# Altium schematic sheet Conversion5V.SchDoc
size A4; SheetNumber: 9; SheetTotal: 9
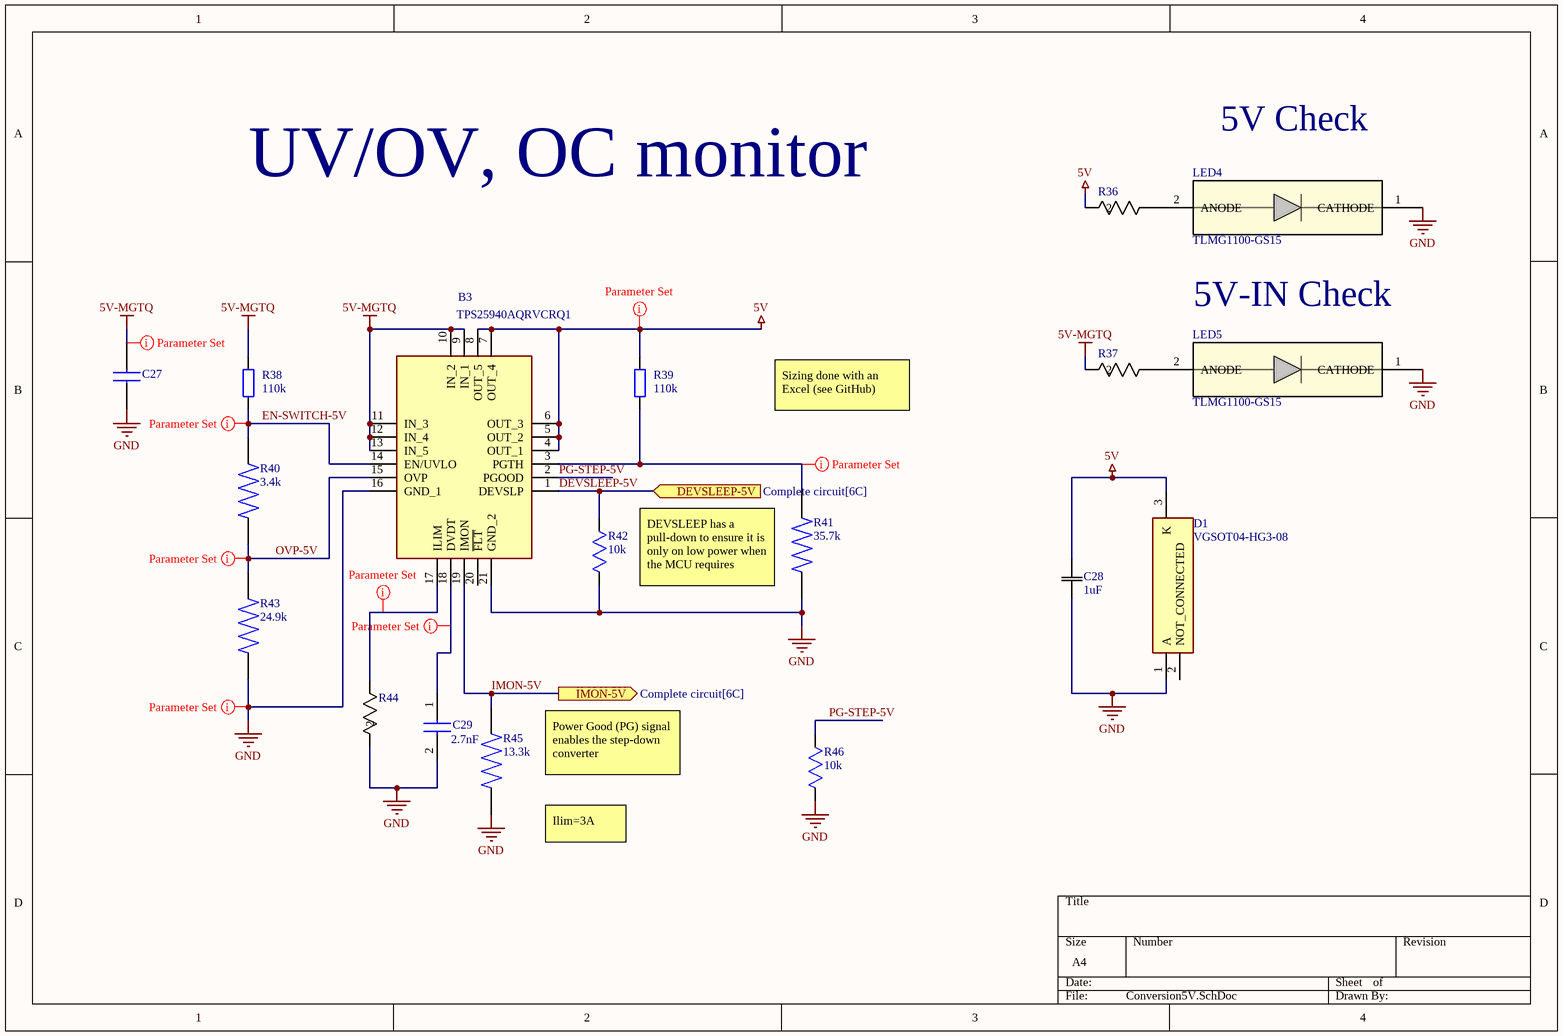
[diagram p0: Conversion5V.SchDoc]

## Parts
B3  TPS25940AQRVCRQ1  [QFN50P300X400X80-21N]
C27  C1206C104K3GACAUTO  [CAPC3216X180N]  (value not drawn)
C28  Capacitance: 1uF  [CAPC18095_95N_KEM]  (hidden comment: C0603X105J4RACAUTO)
C29  Capacitance: 2.7nF  [GCM188]  (hidden comment: GCM1885C1H272FA16J)
D1  VGSOT04-HG3-08  [SOT95P242X112-3N]
LED4  TLMG1100-GS15  [LED_0603_VIS]
LED5  TLMG1100-GS15  [LED_0603_VIS]
R36  MCT0603MD7502BP100  [RES_MCT_0603_VIS]  (value not drawn)
R37  MCT0603MD7502BP100  [RES_MCT_0603_VIS]  (value not drawn)
R38  value 110k  [WRIS-RSKS_0603_Reflow]  (hidden comment: 560112116148)
R39  value 110k  [WRIS-RSKS_0603_Reflow]  (hidden comment: 560112116148)
R40  value 3.4k  [RESC1508X60N]  (hidden comment: RQ73C1J3K4BTD)
R41  value 35.7k  [RESC1508X50N]  (hidden comment: RNCP0603FTD35K7)
R42  value 10k  [RES_ERA3ARB103V]  (hidden comment: ERA3ARB103V)
R43  value 24.9k  [RESC1508X50N]  (hidden comment: RNCP0603FTD24K9)
R44  CRCW060330K1FKEAHP  [RES_CRCW_0603_VIS]  (value not drawn)
R45  value 13.3k  [RESC1608X55N]  (hidden comment: CRCW060313K3FKEAHP)
R46  value 10k  [RES_ERA3ARB103V]  (hidden comment: ERA3ARB103V)

## Ports
DEVSLEEP-5V (in, see Complete circuit[6C]), IMON-5V (out, see Complete circuit[6C])

## Nets
5V: B3.4(OUT_1) B3.5(OUT_2) B3.6(OUT_3) B3.7(OUT_4) B3.8(OUT_5) C28.2 D1.3(K) R36.2 R39.1
5V-MGTQ: B3.9(IN_1) B3.10(IN_2) B3.11(IN_3) B3.12(IN_4) B3.13(IN_5) C27.1 R37.2 R38.1
GND: B3.16(GND_1) B3.21(GND_2) C27.2 C28.1 C29.2 D1.1(A) LED4.1(CATHODE) LED5.1(CATHODE) R41.1 R42.1 R43.1 R44.2 R45.1 R46.1
DEVSLEEP-5V: B3.1(DEVSLP) R42.2 ; port DEVSLEEP-5V
EN-SWITCH-5V: B3.14(EN/UVLO) R38.2 R40.2
IMON-5V: B3.19(IMON) R45.2 ; port IMON-5V
OVP-5V: B3.15(OVP) R40.1 R43.2
PG-STEP-5V: B3.2(PGOOD) R46.2
NetB3_3: B3.3(PGTH) R39.2 R41.2
NetB3_17: B3.17(ILIM) R44.1
NetB3_18: B3.18(DVDT) C29.1
NetLED4_2: LED4.2(ANODE) R36.1
NetLED5_2: LED5.2(ANODE) R37.1

Not connected (* = marked no-connect by the designer): B3 20(~{FLT}); D1 2(NOT_CONNECTED)

## Layout directives
net class SupplyMax: 5V-MGTQ
net class SupplyMin: 5V, EN-SWITCH-5V, GND, NetB3_3, NetB3_17, NetB3_18, OVP-5V

## Notes on the sheet
- 5V Check
- UV/OV, OC monitor
- 5V-IN Check
- Sizing done with an Excel (see GitHub)
- DEVSLEEP has a pull-down to ensure it is only on low power when the MCU requires
- Power Good (PG) signal enables the step-down converter
- Ilim=3A

## Library data of the parts
B3 = CMP-011-00016-1: 2.7V-18V Automotive Current-Limited Load Switch with Current Sense & Short-to-Battery Protection; Manufacturer_Name: Texas Instruments; Geometry.Height: 0.8mm; Source: TPS25940AQRVCRQ1.SchLib; Datasheet Link: http://www.ti.com/lit/gpn/tps25940-q1; Design Item ID: TPS25940AQRVCRQ1; Mouser Price/Stock: https://www.mouser.co.uk/ProductDetail/Texas-Instruments/TPS25940AQRVCRQ1?qs=osPbIpHqQ9Uam0Tf4VM8lQ%3D%3D; Mouser Part Number: 595-TPS25940AQRVCRQ1; Manufacturer_Part_Number: TPS25940AQRVCRQ1
C27 = CMP-001-00115-2: SMD Auto C0G, Ceramic, 0.1 uF, 10%, 25 VDC, 62.5 VDC, 125C, -55C, C0G, SMD, MLCC, Ultra-Stable, Low Loss, Automotive Grade, 0.1 % , 10 GOhms, 36 mg, 1206, 3.2mm, 1.6mm, 1.6mm, 0.5mm, 2000, 78  Weeks, 120; Manufacturer_Name: KEMET; Geometry.Height: 1.8mm; Design Item ID: C1206C104K3GACAUTO; Manufacturer_Part_Number: C1206C104K3GACAUTO; Source: C1206C104K3GACAUTO.SchLib; Datasheet Link: https://content.kemet.com/datasheets/KEM_C1022_C0G_AUTO_SMD.pdf; Mouser Part Number: 80-C1206C104K3GAUTO; Mouser Price/Stock: https://www.mouser.co.uk/ProductDetail/KEMET/C1206C104K3GACAUTO?qs=iLbezkQI%252BsiL409OZdKKSA%3D%3D
C28 = CMP-001-00117-3: SMD Auto X7R Flex, Ceramic, 1 uF, 5%, 16 VDC, X7R, SMD, MLCC, FT-CAP, Automotive Grade, 0603; Manufacturer_Name: Kemet; Copyright: Copyright (C) 2025 Ultra Librarian. All rights reserved.; Source: C0603X105J4RACAUTO.SchLib; Manufacturer_Part_Number: C0603X105J4RACAUTO; Design Item ID: C0603X105J4RACAUTO
C29 = GCM1885C1H272FA16J: Multilayer Ceramic Capacitors MLCC - SMD/SMT 2700 pF 50 VDC 1% 0603 C0G (NP0) AEC-Q200; Manufacturer_Name: Murata Electronics; Datasheet Link: https://search.murata.co.jp/Ceramy/image/img/A01X/G101/ENG/GCM1885C1H272FA16-01A.pdf; Height: 0.9mm; Manufacturer_Part_Number: GCM1885C1H272FA16J
D1 = VGSOT04-HG3-08: Diode ESD (Uni-directional); Manufacturer_Name: Vishay; Datasheet Link: https://www.vishay.com/docs/86326/vgsot03-vgsot36.pdf; Height: 1.12mm; Manufacturer_Part_Number: VGSOT04-HG3-08
LED4 LED5 = CMP-007-00036-1: CHIPLED(SMD 0603-LED) GREEN U.BRIGHT-e4; Manufacturer_Name: Vishay; RefDes: RefDes; Copyright: Copyright (C) 2025 Ultra Librarian. All rights reserved.; Type: Type; Design Item ID: TLMG1100-GS15; Manufacturer_Part_Number: TLMG1100-GS15; Source: TLMG1100-GS15.SchLib
R36 R37 = CMP-009-00216-2: MCT 0603-25 0.1% AT P1 75K; Manufacturer_Name: Vishay; Source: MCT0603MD7502BP100.SchLib; Copyright: Copyright (C) 2025 Ultra Librarian. All rights reserved.; Design Item ID: MCT0603MD7502BP100; Manufacturer_Part_Number: MCT0603MD7502BP100
R38 R39 = CMP-009-00240-1: WRIS-RSKS Thick Film Resistor, size 0603, 110kO, +/-1%, 100mW; Manufacturer: Wurth Elektronik; Temperature Coefficient of Resistance Min: -100ppm/°C; Temperature Coefficient of Resistance Max: 100ppm/°C; Limiting Element Voltage: 75V; Length: 1.6mm; Rated Power: 100mW; Category: Thick Film Resistors; Resistance Tolerance: +/-1%; Source: WRIS-RSKS.SchLib; Height: 0.45mm; Case/Package: 0603; ComponentLink2Description: Datasheet Link; Match Code: WRIS-RSKS; Mount: Surface Mount; Width: 0.8mm; Packaging: Tape and Reel; Component Type: Standard; ComponentLink1URL: https://www.we-online.com/redexpert/article/560112116148?ad; Min Operating Temperature: -55°C; Design Item ID: 560112116148; Max Operating Temperature: 155°C; ComponentLink2URL: https://www.we-online.com/redexpert/spec/560112116148?ad; Pins: 2; ComponentLink1Description: Website Link; Manufacturer Part Number: 560112116148
R40 = CMP-009-00210-1: MP: RQ73C1J3K4BTD; Pins: 2; Source: RQ73C1J3K4BTD.SchLib; Price: None; Availability: Unavailable; Design Item ID: RQ73C1J3K4BTD; Component Type: Standard; Case/Package: None
R41 = CMP-009-00242-1: Res Thin Film 0603 35.7K Ohm 1% 0.125W(1/8W) Â±100ppm/C Sulfur Resistant Molded SMD Paper T/R; MF: Stackpole Electronics Inc; Case/Package: 1508 Stackpole; Component Type: Standard; Pins: 2; Design Item ID: RNCP0603FTD35K7; Check_prices: https://www.snapeda.com/parts/RNCP0603FTD35K7/Stackpole+Electronics/view-part/?ref=eda; Source: RNCP0603FTD35K7.SchLib; MP: RNCP0603FTD35K7; SnapEDA_Link: https://www.snapeda.com/parts/RNCP0603FTD35K7/Stackpole+Electronics/view-part/?ref=snap
R42 R46 = CMP-009-00245-3: Thin Film Resistors - SMD 0603 10Kohm 0.1% 10ppm AEC-Q200; Design Item ID: ERA3ARB103V; Case/Package: None; Pins: 2; Source: ERA3ARB103V.SchLib; Component Type: Standard; MP: ERA3ARB103V; Availability: Unavailable; Price: None
R43 = CMP-009-00241-1: Res Thin Film 0603 24.9K Ohm 1% 0.125W(1/8W) Â±100ppm/C Sulfur Resistant Pad SMD T/R; MF: Stackpole Electronics Inc; Pins: 2; Case/Package: 1508 Stackpole; MP: RNCP0603FTD24K9; SnapEDA_Link: https://www.snapeda.com/parts/RNCP0603FTD24K9/Stackpole+Electronics/view-part/?ref=snap; Design Item ID: RNCP0603FTD24K9; Source: RNCP0603FTD24K9.SchLib; Component Type: Standard; Check_prices: https://www.snapeda.com/parts/RNCP0603FTD24K9/Stackpole+Electronics/view-part/?ref=eda
R44 = CMP-009-00263-3: 30.1 kOhms ±1% 0.333W, 1/3W Chip Resistor 0603 (1608 Metric) Automotive AEC-Q200, Pulse Withstanding Thick Film; Manufacturer_Name: Vishay; Resistance: 30.1k; Datasheet: https://www.vishay.com/doc?20043; Design Item ID: CRCW060330K1FKEAHP; Source: CRCW060330K1FKEAHP.SchLib; Copyright: Copyright (C) 2026 Ultra Librarian. All rights reserved.; Manufacturer_Part_Number: CRCW060330K1FKEAHP
R45 = CMP-009-00260-1: 13.3 kOhms Â±1% 0.333W, 1/3W Chip Resistor 0603 (1608 Metric) Automotive AEC-Q200, Pulse Withstanding Thick Film; MF: Vishay; Source: CRCW060313K3FKEAHP.SchLib; Component Type: Standard; Case/Package: 1608 Vishay; SnapEDA_Link: https://www.snapeda.com/parts/CRCW060313K3FKEAHP/Vishay/view-part/?ref=snap; MP: CRCW060313K3FKEAHP; Design Item ID: CRCW060313K3FKEAHP; Pins: 2; Check_prices: https://www.snapeda.com/parts/CRCW060313K3FKEAHP/Vishay/view-part/?ref=eda